# Altium schematic sheet Sheet1.SchDoc: ИЛ190СП1/1
size 410 x 297 mm; ApprovedBy: Кубатко В.А.; CheckedBy: Кубатко В.А.; Author: Сергеев Д.А.; CompanyName: ГК "СНАБЖЕНИЕ"; DrawnBy: Сергеев Д.А.; Engineer: Сергеев Д.А.; Organization: ГК "СНАБЖЕНИЕ"; DocumentNumber: ИЛ190СП1/1; Revision: 1; SheetNumber: 1; SheetTotal: 1
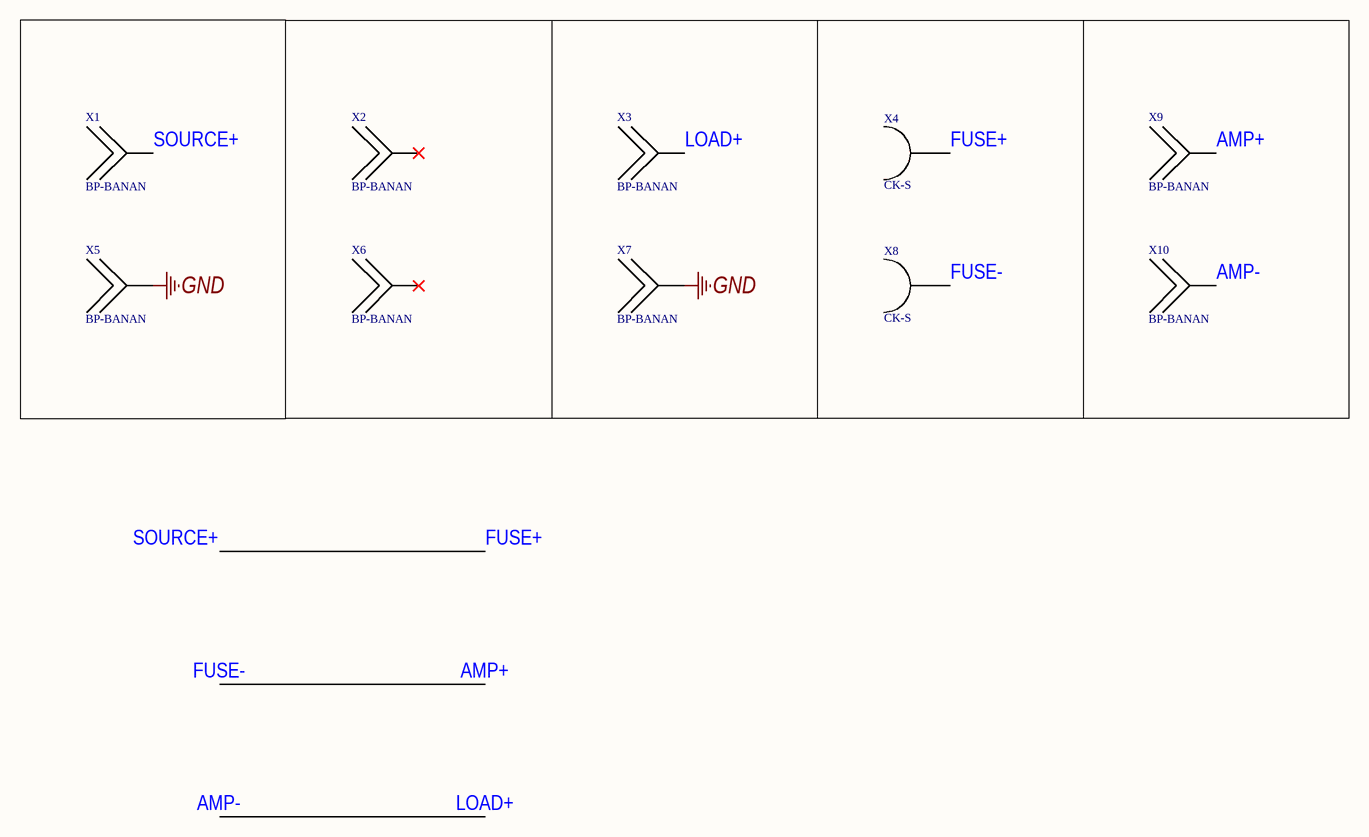
[diagram p0: Sheet1.SchDoc]

## Parts
X1  BP-BANAN  [BP BANAN]
X2  BP-BANAN  [BP BANAN]
X3  BP-BANAN  [BP BANAN]
X4  CK-S  [CK-S]
X5  BP-BANAN  [BP BANAN]
X6  BP-BANAN  [BP BANAN]
X7  BP-BANAN  [BP BANAN]
X8  CK-S  [CK-S]
X9  BP-BANAN  [BP BANAN]
X10  BP-BANAN  [BP BANAN]

## Nets
GND: X5.1 X7.1
AMP+: X8.1 X9.1  [also labelled FUSE-]
AMP-: X3.1 X10.1  [also labelled LOAD+]
FUSE+: X1.1 X4.1  [also labelled SOURCE+]

Not connected (* = marked no-connect by the designer): X2 1*; X6 1*

## Notes on the sheet
- Перв. примен.
- Справ. №
- Подп. и дата
- Инв. № дубл.
- Взам. инв. №
- Разраб.
- Изм.
- Лист
- № докум.
- Подп.
- Дата
- Литера
- Масса
- Масштаб
- Пров.
- Т.контр.
- Листов
- Инв. № подл.
- Н.контр.
- Утв.
- Форма 1 ГОСТ 2.104-2006
- Копировал
- Формат А3